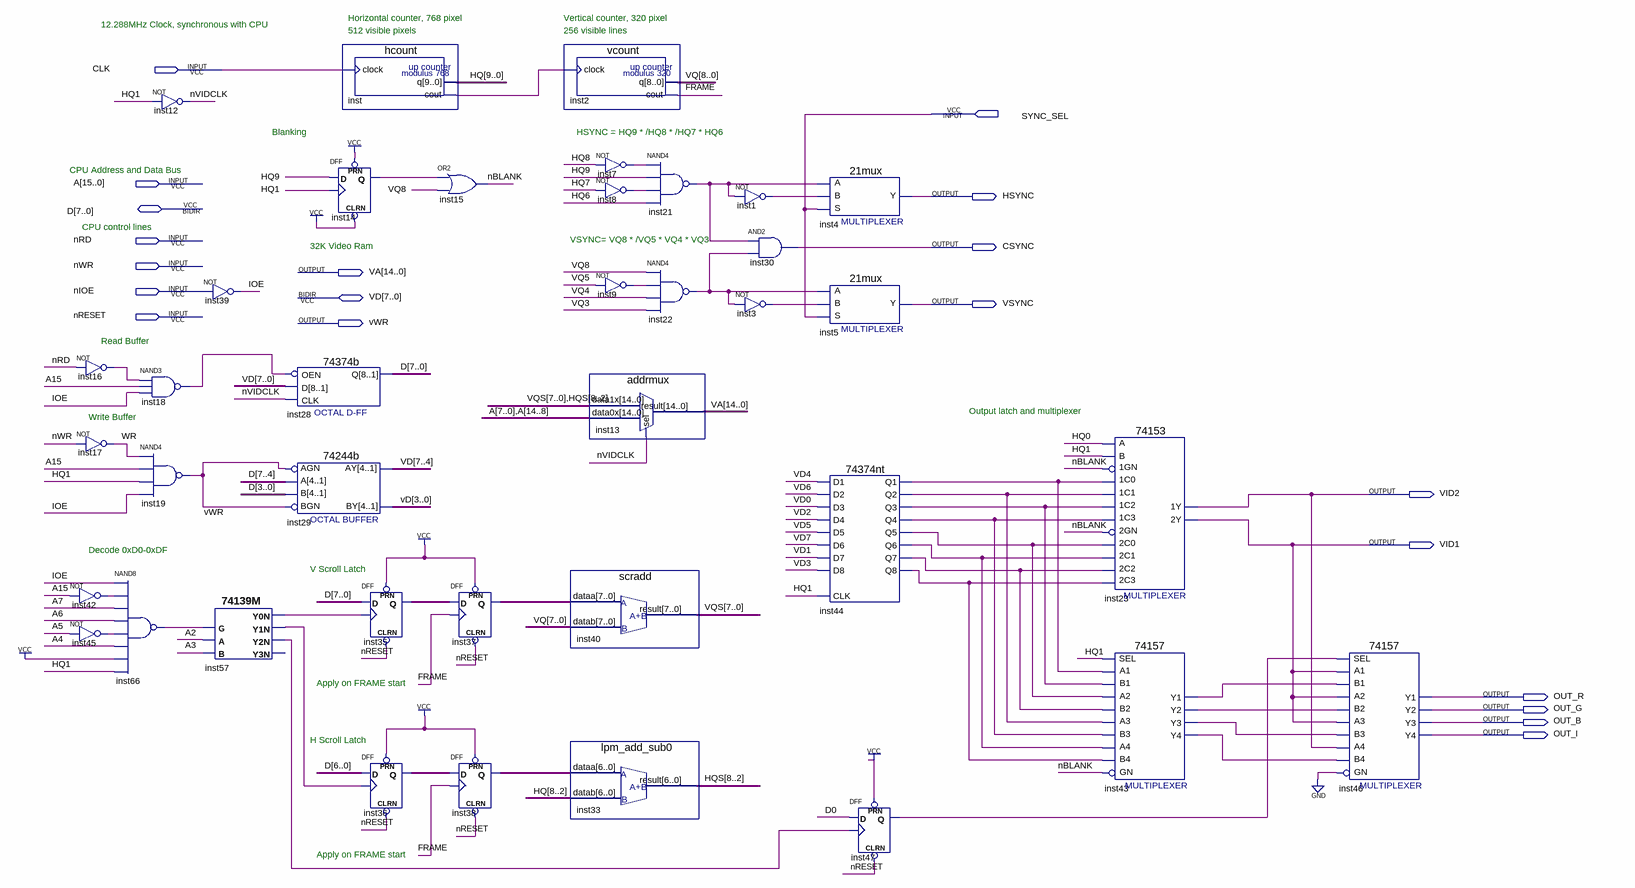
[diagram p0: schematic sheet]
// Quartus schematic timvideo.bdf as structural Verilog: 38 symbols, 20 pins
module timvideo (
  input  CLK,
  input  SYNC_SEL,
  input  [15:0] A,
  input  nRD,
  input  nWR,
  input  nIOE,
  input  nRESET,
  inout  [7:0] D,
  inout  [7:0] VD,
  output HSYNC,
  output CSYNC,
  output [14:0] VA,
  output VSYNC,
  output vWR,
  output VID2,
  output VID1,
  output OUT_R,
  output OUT_G,
  output OUT_B,
  output OUT_I
);

  wire FRAME, inst1_out, inst3_out, inst7_out, inst8_out, inst9_out, inst14_q, inst16_out, inst18_out,
       inst21_out, inst22_out, inst42_out, inst43_y1, inst43_y2, inst43_y3, inst43_y4, inst44_q1, inst44_q2,
       inst44_q3, inst44_q4, inst44_q5, inst44_q6, inst44_q7, inst44_q8, inst45_out, inst47_q, inst57_y0n,
       inst57_y1n, inst57_y2n, inst66_out, inst_cout, IOE, nBLANK, nVIDCLK, WR;
  wire [6:0] inst36_q, inst38_q;
  wire [7:0] inst35_q, inst37_q, VQS;
  wire [8:0] VQ;
  wire [8:2] HQS;
  wire [9:0] HQ;

  not inst16 (inst16_out, nRD);
  not inst17 (WR, nWR);
  nand inst66 (inst66_out, IOE, inst42_out, A[7], A[6], inst45_out, A[4], 1'b1, HQ[1]);
  not inst42 (inst42_out, A[15]);
  not inst45 (inst45_out, A[5]);
  not inst12 (nVIDCLK, HQ[1]);
  nand inst18 (inst18_out, inst16_out, A[15], IOE);
  nand inst19 (vWR, WR, A[15], HQ[1], IOE);
  not inst39 (IOE, nIOE);
  \74139M  inst57 (
    .B(A[3]), .A(A[2]), .G(inst66_out), .Y2N(inst57_y2n), .Y0N(inst57_y0n), .Y1N(inst57_y1n));  // open: Y3N
  \74374b  inst28 (.D(VD), .OEN(inst18_out), .CLK(nVIDCLK), .Q(D));
  \74244b  inst29 (.AGN(vWR), .B(D[3:0]), .BGN(vWR), .A(D[7:4]), .AY(VD[7:4]), .BY(VD[3:0]));
  hcount inst (.clock(CLK), .cout(inst_cout), .q(HQ));
  DFF inst14 (.CLRN(1'b1), .CLK(HQ[1]), .D(HQ[9]), .PRN(1'b1), .Q(inst14_q));
  DFF inst35[7:0] (.CLRN(nRESET), .CLK(inst57_y0n), .D(D), .PRN(1'b1), .Q(inst35_q));
  DFF inst36[6:0] (.CLRN(nRESET), .CLK(inst57_y1n), .D(D[6:0]), .PRN(1'b1), .Q(inst36_q));
  or inst15 (nBLANK, inst14_q, VQ[8]);
  DFF inst37[7:0] (.CLRN(nRESET), .CLK(FRAME), .D(inst35_q), .PRN(1'b1), .Q(inst37_q));
  DFF inst38[6:0] (.CLRN(nRESET), .CLK(FRAME), .D(inst36_q), .PRN(1'b1), .Q(inst38_q));
  vcount inst2 (.clock(inst_cout), .cout(FRAME), .q(VQ));
  scradd inst40 (.dataa(inst37_q), .datab(VQ[7:0]), .result(VQS));
  lpm_add_sub0 inst33 (.dataa(inst38_q), .datab(HQ[8:2]), .result(HQS));
  not inst7 (inst7_out, HQ[8]);
  not inst8 (inst8_out, HQ[7]);
  not inst9 (inst9_out, VQ[5]);
  addrmux inst13 (.data1x({VQS, HQS}), .data0x({A[7:0], A[14:8]}), .sel(nVIDCLK), .result(VA));
  nand inst21 (inst21_out, inst7_out, HQ[9], inst8_out, HQ[6]);
  nand inst22 (inst22_out, VQ[8], inst9_out, VQ[4], VQ[3]);
  not inst1 (inst1_out, inst21_out);
  and inst30 (CSYNC, inst21_out, inst22_out);
  not inst3 (inst3_out, inst22_out);
  \21mux  inst4 (.S(SYNC_SEL), .B(inst1_out), .A(inst21_out), .Y(HSYNC));
  \21mux  inst5 (.S(SYNC_SEL), .B(inst3_out), .A(inst22_out), .Y(VSYNC));
  \74374nt  inst44 (
    .D3(VD[0]), .D2(VD[6]), .D1(VD[4]), .D7(VD[1]), .D6(VD[7]), .D4(VD[2]), .D5(VD[5]), .D8(VD[3]),
    .CLK(HQ[1]), .Q8(inst44_q8), .Q7(inst44_q7), .Q6(inst44_q6), .Q3(inst44_q3), .Q4(inst44_q4),
    .Q5(inst44_q5), .Q1(inst44_q1), .Q2(inst44_q2));
  DFF inst47 (.CLRN(nRESET), .CLK(inst57_y2n), .D(D[0]), .PRN(1'b1), .Q(inst47_q));
  \74153  inst23 (
    .\1C1 (inst44_q2), .\1GN (nBLANK), .\1C0 (inst44_q1), .\2C0 (inst44_q5), .\2GN (nBLANK),
    .\2C2 (inst44_q7), .\1C2 (inst44_q3), .\1C3 (inst44_q4), .B(HQ[1]), .A(HQ[0]), .\2C1 (inst44_q6),
    .\2C3 (inst44_q8), .\1Y (VID2), .\2Y (VID1));
  \74157  inst43 (
    .A1(inst44_q1), .B1(inst44_q3), .SEL(HQ[1]), .B2(inst44_q7), .A3(inst44_q2), .B3(inst44_q4),
    .A2(inst44_q5), .B4(inst44_q8), .GN(nBLANK), .A4(inst44_q6), .Y2(inst43_y2), .Y1(inst43_y1),
    .Y4(inst43_y4), .Y3(inst43_y3));
  \74157  inst46 (
    .A1(VID1), .B1(inst43_y1), .SEL(inst47_q), .B2(inst43_y2), .A3(VID1), .B3(inst43_y3), .A2(VID1),
    .B4(inst43_y4), .GN(1'b0), .A4(VID2), .Y2(OUT_G), .Y1(OUT_R), .Y4(OUT_I), .Y3(OUT_B));

  // Notes on the sheet:
  //   Horizontal counter, 768 pixel
  //   Vertical counter, 320 pixel
  //   12.288MHz Clock, synchronous with CPU
  //   512 visible pixels
  //   256 visible lines
  //   Blanking
  //   HSYNC = HQ9 * /HQ8 * /HQ7 * HQ6
  //   CPU Address and Data Bus
  //   CPU control lines
  //   VSYNC= VQ8 * /VQ5 * VQ4 * VQ3
  //   32K Video Ram
  //   Read Buffer
  //   Output latch and multiplexer
  //   Write Buffer
  //   Decode 0xD0-0xDF
  //   V Scroll Latch
  //   Apply on FRAME start
  //   H Scroll Latch
  //   Apply on FRAME start
endmodule
